# Altium schematic sheet POGO_LIQUID_TEST_V1.0.SchDoc
size A4; SheetNumber: 1; SheetTotal: 1
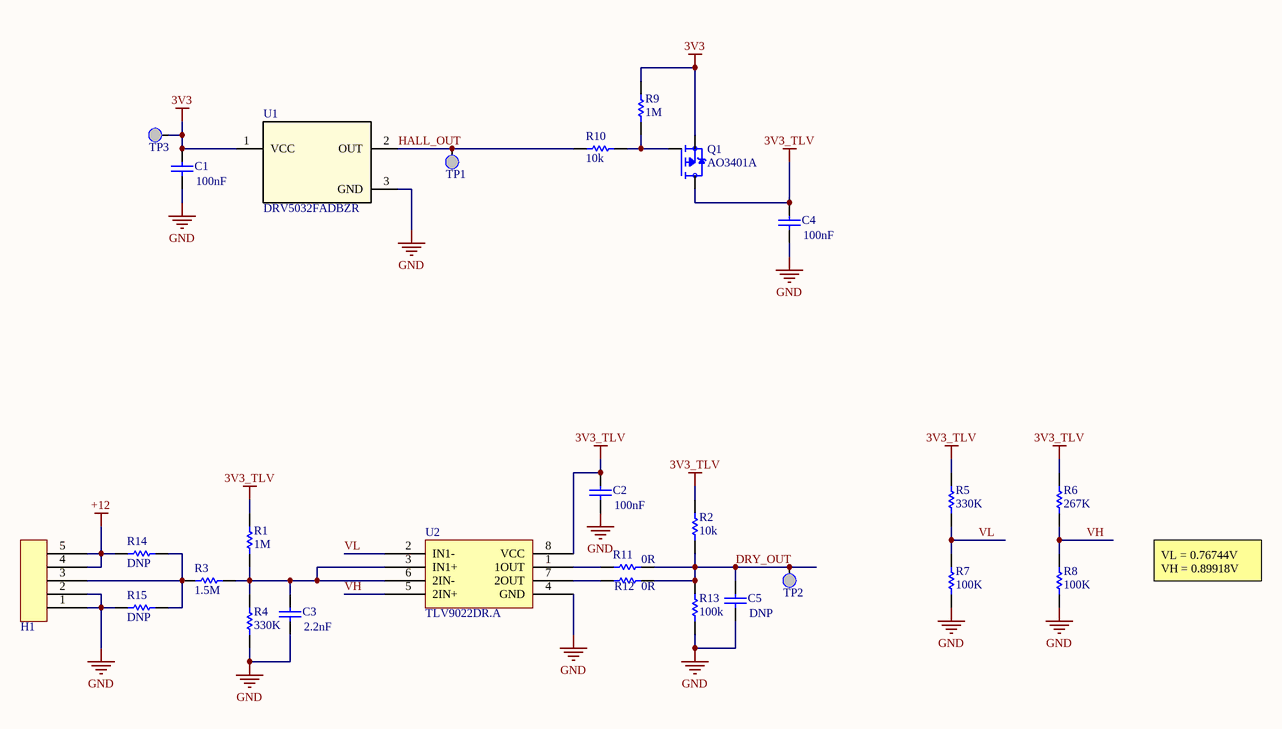
[diagram p0: POGO_LIQUID_TEST_V1.0.SchDoc]

## Parts
C1  100nF  [C0402L]
C2  100nF  [C0402L]
C3  2.2nF  [C0402L]
C4  100nF  [C0402L]
C5  DNP  [C0402L]
H1  5xPOGO_PIN  [PAD POGOPIN]  (value not drawn)
Q1  AO3401A  [SOT23-3]
R1  1M  [R0402L1]
R2  10k  [R0402L1]
R3  1.5M  [R0402L1]
R4  330K  [R0402L1]
R5  330K  [R0402L1]
R6  267K  [R0402L1]
R7  100K  [R0402L1]
R8  100K  [R0402L1]
R9  1M  [R0402L1]
R10  10k  [R0402L1]
R11  0R  [R0402L1]
R12  0R  [R0402L1]
R13  100k  [R0402L1]
R14  DNP  [R0402L1]
R15  DNP  [R0402L1]
TP1  TP_?  [TP_SMD_1P50]  (value not drawn)
TP2  TP_?  [TP_SMD_1P50]  (value not drawn)
TP3  TP_?  [TP_SMD_1P50]  (value not drawn)
U1  DRV5032FADBZR  [DBZ0003A-MFG]
U2  TLV9022DR.A  [D0008A-MFG]

## Nets
3V3: C1.1 Q1.2(S) R9.2 TP3.1(TP) U1.1(VCC)
3V3_TLV: C2.1 C4.1 Q1.3(D) R1.2 R2.2 R5.2 R6.2 U2.8(VCC)
+12: H1.4 H1.5 R14.2
GND: C1.2 C2.2 C3.2 C4.2 C5.2 H1.1 H1.2 R4.1 R7.1 R8.1 R13.1 R15.2 U1.3(GND) U2.4(GND)
DRY_OUT: C5.1 R2.1 R11.1 R12.1 R13.2 TP2.1(TP)
HALL_OUT: R10.2 TP1.1(TP) U1.2(OUT)
VH: R6.1 R8.2 U2.5(2IN+)
VL: R5.1 R7.2 U2.2(IN1-)
NetC3_1: C3.1 R1.1 R3.1 R4.2 U2.3(IN1+) U2.6(2IN-)
NetH1_3: H1.3 R3.2 R14.1 R15.1
NetQ1_1: Q1.1(G) R9.1 R10.1
NetR11_2: R11.2 U2.1(1OUT)
NetR12_2: R12.2 U2.7(2OUT)

## Notes on the sheet
- VL = 0.76744V
  VH = 0.89918V

## Library data of the parts
C1-C5 = C0402: CAP 0402 MLCC NON-POLARIZED GENERIC; VALUE TOLERANCE VOLTAGE AND MPN SET ON INSTANCE; Type: Capacitor; Value2: SET_VOLTAGE; Case: 0402; Package: 0402
  C1 C2 C4: Value1: 100nF
  C3: Value1: 2.2nF
  C5: Value1: DNP
Q1 = AO3401A: P-MOS SOT-23 Vds_-30V IdMax_-4A@TA25C AO3401A; MF: Alpha & Omega Semiconductor; SnapEDA_Link: https://www.snapeda.com/parts/AO3401A/Alpha/view-part/?ref=snap; Package: SOT-23; Value: *; Check_prices: https://www.snapeda.com/parts/AO3401A/Alpha/view-part/?ref=eda; JLCPCB Part #: C15127; LCSC Part #: C15127; Manufacturer: Alpha & Omega Semiconductor; Manufacturer Part Number: AO3401A; MP: AO3401A
R1-R15 = R0402_4: RES 0402 GENERIC; VALUE TOLERANCE POWER AND MPN SET ON INSTANCE; Value1: SET_VALUE; Case: 0402; Type: Resistor; Package: 0402
TP1-TP3 = TEST_POINT: TP SMD 1P PadDia_1.50mm ROUND COPPER TEST POINT
U1 = DRV5032FADBZR: Low-power (5Hz, <1ÂµA) low-voltage (up to 5.5V) switch 3-SOT-23 -40 to 85; Manufacturer_Name: Texas Instruments; TYPE: TYPE; RefDes: RefDes; Copyright: Copyright (C) 2026 Ultra Librarian. All rights reserved.; Manufacturer_Part_Number: DRV5032FADBZR
U2 = TLV9022DR.A: Dual precision comparator with open-drain output 8-SOIC -40 to 125